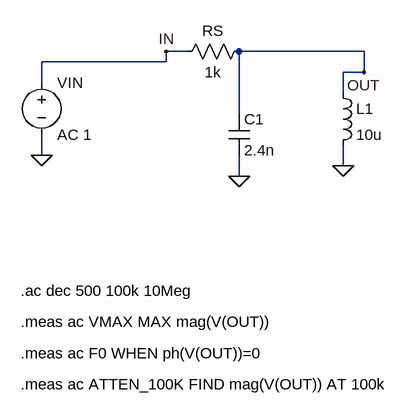
[diagram p0: schematic demo1_rlc_bandpass.asc]
demo1_rlc_bandpass.asc, the LTspice schematic file:
Version 4
SHEET 1 1600 1280
WIRE 96 368 96 400
WIRE 320 240 288 240
WIRE 400 240 400 336
WIRE 400 240 432 240
WIRE 400 400 400 432
WIRE 560 304 560 272
WIRE 560 272 592 272
WIRE 560 384 560 416
WIRE 96 288 96 256
WIRE 96 256 128 256
WIRE 128 256 288 256
WIRE 288 256 288 240
WIRE 432 240 592 240
WIRE 592 240 592 272
FLAG 96 400 0
FLAG 288 240 IN
FLAG 400 432 0
FLAG 592 272 OUT
FLAG 560 416 0
SYMBOL voltage 96 272 R0
WINDOW 3 24 96 Left 2
SYMATTR InstName VIN
SYMATTR Value AC 1
SYMBOL res 416 224 R90
WINDOW 0 0 56 VBottom 2
WINDOW 3 32 56 VTop 2
SYMATTR InstName RS
SYMATTR Value 1k
SYMBOL cap 384 336 R0
SYMATTR InstName C1
SYMATTR Value 2.4n
SYMBOL ind 544 288 R0
SYMATTR InstName L1
SYMATTR Value 10u
SYMATTR SpiceLine Rser=0.5
TEXT 64 608 Left 2 !.ac dec 500 100k 10Meg
TEXT 64 656 Left 2 !.meas ac VMAX MAX mag(V(OUT))
TEXT 64 704 Left 2 !.meas ac F0 WHEN ph(V(OUT))=0
TEXT 64 752 Left 2 !.meas ac ATTEN_100K FIND mag(V(OUT)) AT 100k

The netlist it stands for:
* demo1_rlc_bandpass.asc
VIN IN 0 AC 1
RS OUT IN 1k
C1 OUT 0 2.4n
L1 OUT 0 10u Rser=0.5
.ac dec 500 100k 10Meg
.meas ac VMAX MAX mag(V(OUT))
.meas ac F0 WHEN ph(V(OUT))=0
.meas ac ATTEN_100K FIND mag(V(OUT)) AT 100k
.backanno
.end